# Altium project Micro 26-27.PrjPcb
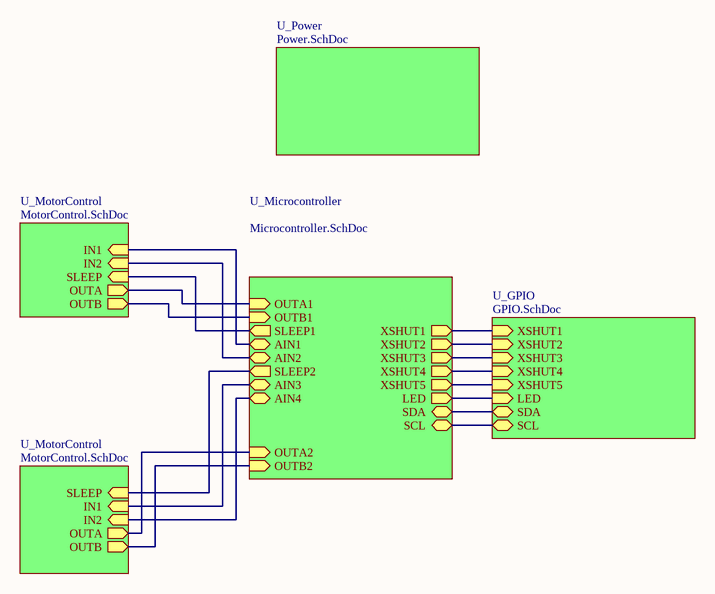
[diagram p0: Micromouse.SchDoc]
5 sheets, 51 parts. Net scope: hierarchical (ports join the sheet entries above them; power ports are global).
Board files: PCB1.PcbDoc, PCB2.PcbDoc
Sheets:
  Micromouse.SchDoc
    U_GPIO = GPIO.SchDoc
    U_Microcontroller = Microcontroller.SchDoc
    U_MotorControl = MotorControl.SchDoc
    U_Power = Power.SchDoc
    U_MotorControl = MotorControl.SchDoc

## Sheet Micromouse.SchDoc
size A

### Sub-sheets
U_GPIO = GPIO.SchDoc: XSHUT1 (in), XSHUT2 (in), XSHUT3 (in), XSHUT4 (in), XSHUT5 (in), LED (in), SCL (bidir), SDA (bidir)
U_Microcontroller = Microcontroller.SchDoc: XSHUT2 (out), AIN3 (bidir), AIN4 (bidir), SDA (bidir), SCL (bidir), AIN2 (bidir), AIN1 (bidir), XSHUT1 (out), XSHUT3 (out), XSHUT4 (out), XSHUT5 (out), LED (out), OUTA1 (in), OUTB1 (in), OUTB2 (in), OUTA2 (in), SLEEP1 (out), SLEEP2 (out)
U_MotorControl = MotorControl.SchDoc: IN2 (in), SLEEP (in), IN1 (in), OUTA (out), OUTB (out)
U_MotorControl = MotorControl.SchDoc: IN2 (in), IN1 (in), SLEEP (in), OUTA (out), OUTB (out)
U_Power = Power.SchDoc: no entries

### Nets
SCL: sheet U_GPIO/SCL, sheet U_Microcontroller/SCL
SDA: sheet U_GPIO/SDA, sheet U_Microcontroller/SDA
Net*1_0: sheet U_GPIO/XSHUT1, sheet U_Microcontroller/XSHUT1
Net*1_4: sheet U_GPIO/XSHUT2, sheet U_Microcontroller/XSHUT2
Net*1_5: sheet U_Microcontroller/AIN4, sheet U_MotorControl/IN2
Net*1_6: sheet U_Microcontroller/AIN3, sheet U_MotorControl/IN1
Net*1_7: sheet U_Microcontroller/OUTB1, sheet U_MotorControl/OUTB
Net*1_8: sheet U_Microcontroller/OUTA1, sheet U_MotorControl/OUTA
Net*1_9: sheet U_Microcontroller/SLEEP1, sheet U_MotorControl/SLEEP
Net*1_10: sheet U_Microcontroller/AIN1, sheet U_MotorControl/IN1
Net*1_11: sheet U_Microcontroller/AIN2, sheet U_MotorControl/IN2
Net*1_12: sheet U_GPIO/LED, sheet U_Microcontroller/LED
Net*1_13: sheet U_Microcontroller/OUTA2, sheet U_MotorControl/OUTA
Net*1_14: sheet U_Microcontroller/OUTB2, sheet U_MotorControl/OUTB
Net*1_15: sheet U_Microcontroller/SLEEP2, sheet U_MotorControl/SLEEP
Net*1_21: sheet U_GPIO/XSHUT4, sheet U_Microcontroller/XSHUT4
Net*1_22: sheet U_GPIO/XSHUT5, sheet U_Microcontroller/XSHUT5
Net*1_23: sheet U_GPIO/XSHUT3, sheet U_Microcontroller/XSHUT3

## Sheet GPIO.SchDoc
size A
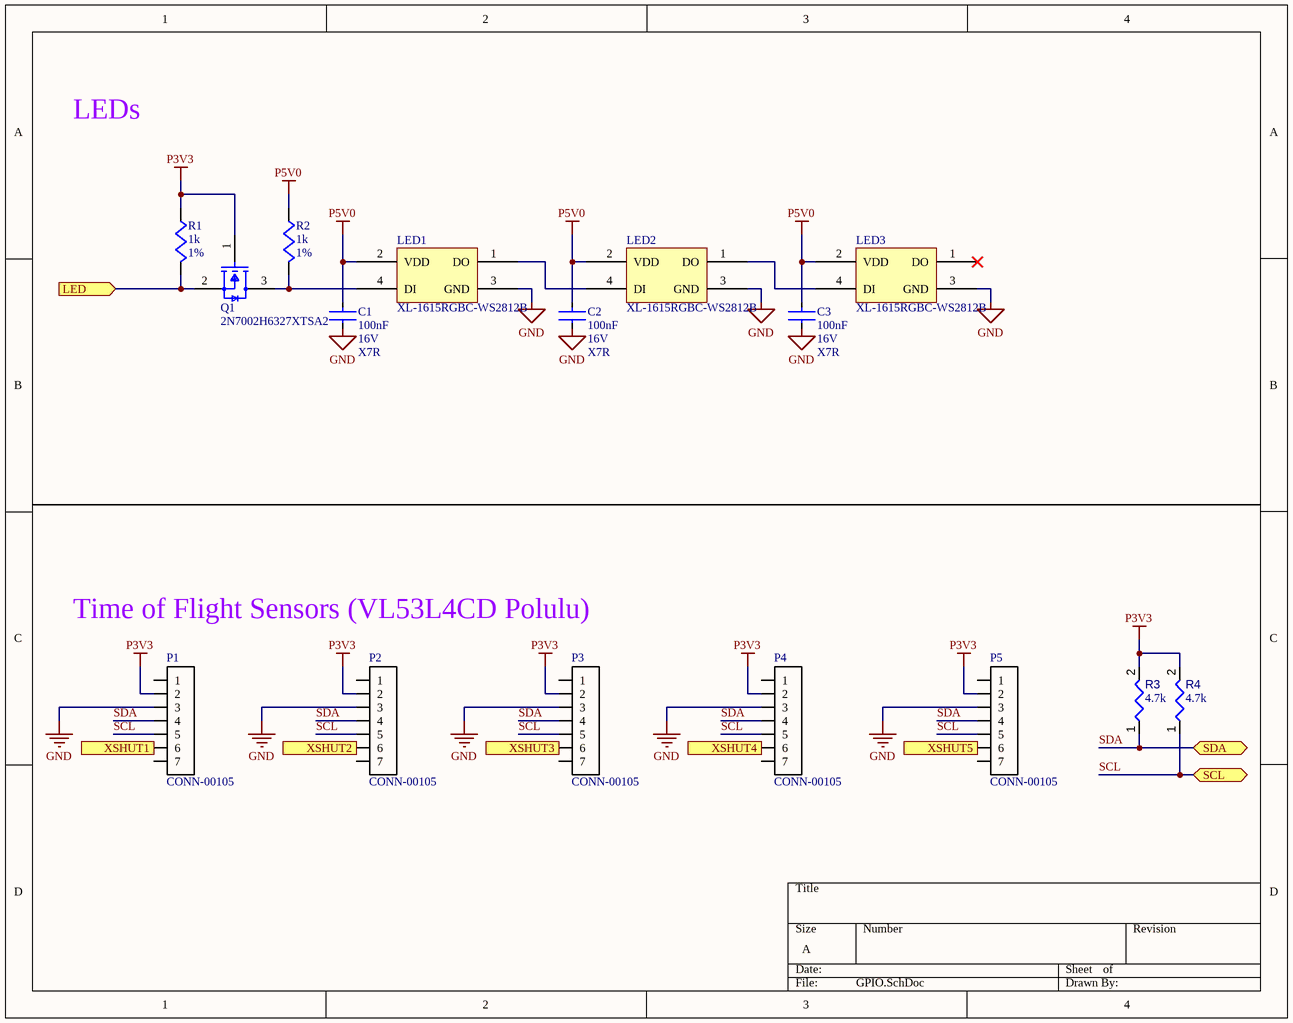
[diagram p1: GPIO.SchDoc]

### Parts
C1  value 100nF  Voltage: 16V  Dielectric: X7R  [C0402]  (hidden comment: 100n 16V X7R 0402)
C2  value 100nF  Voltage: 16V  Dielectric: X7R  [C0402]  (hidden comment: 100n 16V X7R 0402)
C3  value 100nF  Voltage: 16V  Dielectric: X7R  [C0402]  (hidden comment: 100n 16V X7R 0402)
LED1  XL-1615RGBC-WS2812B  [XL-1615RGBC-WS2812B-Footprint-1]
LED2  XL-1615RGBC-WS2812B  [XL-1615RGBC-WS2812B-Footprint-1]
LED3  XL-1615RGBC-WS2812B  [XL-1615RGBC-WS2812B-Footprint-1]
P1  CONN-00105  [HDDR_7x1_0]
P2  CONN-00105  [HDDR_7x1_0]
P3  CONN-00105  [HDDR_7x1_0]
P4  CONN-00105  [HDDR_7x1_0]
P5  CONN-00105  [HDDR_7x1_0]
Q1  2N7002H6327XTSA2  [FP-PG-SOT23-3-MFG]
R1  value 1k  Tolerance: 1%  [R0402]  (hidden comment: 1k 1% 0402)
R2  value 1k  Tolerance: 1%  [R0402]  (hidden comment: 1k 1% 0402)
R3  value 4.7k  [RESC2013X70X40ML20T20]  (hidden comment: Resistor 4k7 +/-1% 0805 125 mW)
R4  value 4.7k  [RESC2013X70X40ML20T20]  (hidden comment: Resistor 4k7 +/-1% 0805 125 mW)

### Ports
LED (in), SCL (bidir), SDA (bidir), XSHUT1 (in), XSHUT2 (in), XSHUT3 (in), XSHUT4 (in), XSHUT5 (in)

### Nets
GND: C1.2 C2.2 C3.2 LED1.3(GND) LED2.3(GND) LED3.3(GND) P1.3 P2.3 P3.3 P4.3 P5.3
P3V3: P1.2 P2.2 P3.2 P4.2 P5.2 Q1.1(gate) R1.1 R3.2 R4.2
P5V0: C1.1 C2.1 C3.1 LED1.2(VDD) LED2.2(VDD) LED3.2(VDD) R2.1
SCL: P1.5 P2.5 P3.5 P4.5 P5.5 R4.1 ; port SCL
SDA: P1.4 P2.4 P3.4 P4.4 P5.4 R3.1 ; port SDA
Net*1_0: P1.6 ; port XSHUT1
Net*1_4: P2.6 ; port XSHUT2
Net*1_12: Q1.2(source) R1.2 ; port LED
Net*1_21: P4.6 ; port XSHUT4
Net*1_22: P5.6 ; port XSHUT5
Net*1_23: P3.6 ; port XSHUT3
NetLED1_1: LED1.1(DO) LED2.4(DI)
NetLED1_4: LED1.4(DI) Q1.3(drain) R2.2
NetLED2_1: LED2.1(DO) LED3.4(DI)

Not connected (* = marked no-connect by the designer): LED3 1(DO)*; P1 1 7; P2 1 7; P3 1 7; P4 1 7; P5 1 7

### Notes on the sheet
- LEDs
- Time of Flight Sensors (VL53L4CD Polulu)

### Library data of the parts
C1-C3 = CMP-001-00088-6: 100nF 16V X7R ±10% 0402 Multilayer Ceramic Capacitors MLCC - SMD/SMT ROHS; LCSC Part #: C1525; Package: 0402
LED1-LED3 = CMP-007-00038-3: 1615  RGB LEDs(Built-in IC) ROHS; LED Type: Addressable; LCSC Part #: C5349954; Package: SMD-4P,1.6x1.5mm
P1-P5 = CMP-019-000100-1: Header, 7x1, 0.1"; Manufacturer: Samtec; Manufacturer PN: TSW-107-07-F-S; Positions per level: 7; Levels: 1; Type: Header; Cost: 0.61; Part Number: CONN-00105; Pin Count: 7; Component Type: Standard; Design Item ID: CONN-00105; Source: Connectors$.SchLib
Q1 = CMP-32901-000180-1: MOSFET N-CH 60V 0.3A SOT23; Rise Time: 3.3ns; Input Capacitance: 20pF; Rds On Max: 3R; Gate to Source Voltage (Vgs): 20V; Continuous Drain Current (ID): 300mA; Max Power Dissipation: 500mW; Packaging: Tape and Reel; Mount: Surface Mount; Case/Package: SOT-23; Drain to Source Voltage (Vdss): 60V; Min Operating Temperature: -55°C; Halogen Free: Halogen Free; Max Dual Supply Voltage: 60V; Number of Pins: 3; Lead Free: Lead Free; Max Operating Temperature: 150°C
R1 R2 = CMP-009-00189-3: 62.5mW Thick Film Resistors 50V ±100ppm/℃ ±1% 1kΩ 0402 Chip Resistor - Surface Mount ROHS; LCSC Part #: C106235; Package: 0402
R3 R4 = CMP-009-00032-4: Chip Resistor, 4.7 KOhm, +/- 1%, 0.125 W, -55 to 155 degC, 0805 (2012 Metric); Power: 125mW; Voltage Rating: 150V; RoHS Compliant: True; Tolerance: 1%; Case/Package: 0805; Pins: 2; Max Operating Temperature: 155°C; Mounting Technology: SM; Min Operating Temperature: -55°C

## Sheet Microcontroller.SchDoc
size A
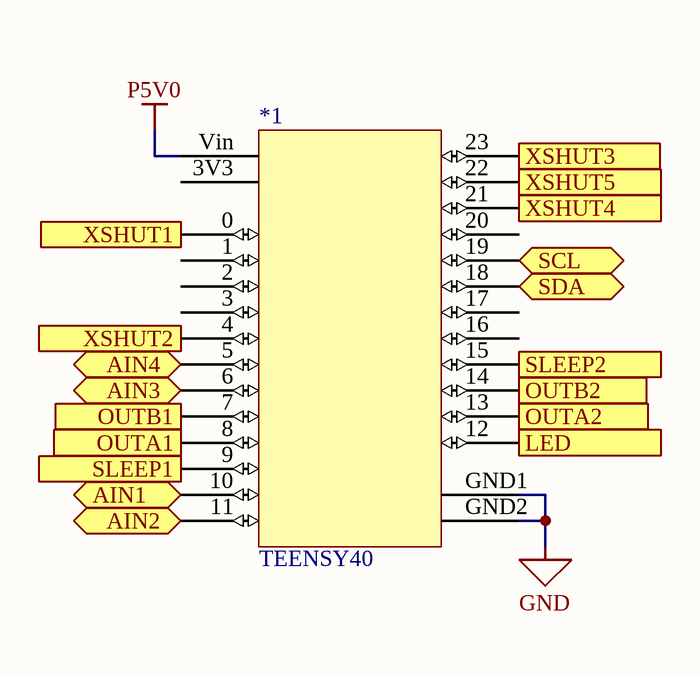
[diagram p2: Microcontroller.SchDoc]

### Parts
*1  TEENSY40  [TEENSY40-Footprint-1]

### Ports
AIN1 (bidir), AIN2 (bidir), AIN3 (bidir), AIN4 (bidir), LED (out), OUTA1 (in), OUTA2 (in), OUTB1 (in), OUTB2 (in), SCL (bidir), SDA (bidir), SLEEP1 (out), SLEEP2 (out), XSHUT1 (out), XSHUT2 (out), XSHUT3 (out), XSHUT4 (out), XSHUT5 (out)

### Nets
GND: *1.GND1(GND) *1.GND2(GND)
P5V0: *1.Vin
SCL: *1.19 ; port SCL
SDA: *1.18 ; port SDA
Net*1_0: *1.0 ; port XSHUT1
Net*1_4: *1.4 ; port XSHUT2
Net*1_5: *1.5 ; port AIN4
Net*1_6: *1.6 ; port AIN3
Net*1_7: *1.7 ; port OUTB1
Net*1_8: *1.8 ; port OUTA1
Net*1_9: *1.9 ; port SLEEP1
Net*1_10: *1.10 ; port AIN1
Net*1_11: *1.11 ; port AIN2
Net*1_12: *1.12 ; port LED
Net*1_13: *1.13 ; port OUTA2
Net*1_14: *1.14 ; port OUTB2
Net*1_15: *1.15 ; port SLEEP2
Net*1_21: *1.21 ; port XSHUT4
Net*1_22: *1.22 ; port XSHUT5
Net*1_23: *1.23 ; port XSHUT3

Not connected (* = marked no-connect by the designer): *1 1 2 3 3V3 16 17 20

### Library data of the parts
*1 = CMP-020-00024-3: PJRC Teensy 4.0 USB Development Board

## Sheet MotorControl.SchDoc
size A
Used 2 times, as channels U_MotorControl, U_MotorControl. Parts and nets are listed once, with the designators drawn on the sheet.
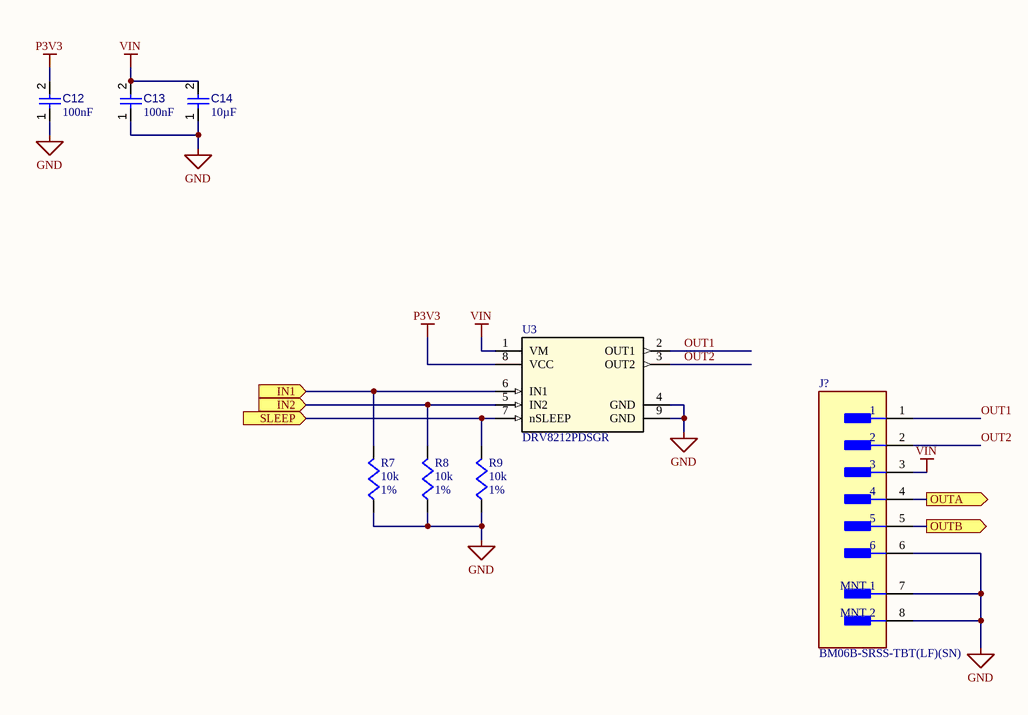
[diagram p3: MotorControl.SchDoc]

### Parts
C12  value 100nF  [CAPC0402(1005)60_L]  (hidden comment: Capacitor 100nF +/-20% 25V 0402)
C13  value 100nF  [CAPC0402(1005)60_L]  (hidden comment: Capacitor 100nF +/-20% 25V 0402)
C14  value 10µF  [CAPC2013X135X45NL10T25]  (hidden comment: Capacitor 10 uF +/- 10% 16 V 0805)
J?  BM06B-SRSS-TBT(LF)(SN)  [FP-BM06B-SRSS-TBT_LF_SN-MFG]
R7  value 10k  Tolerance: 1%  [R0402]  (hidden comment: 10k 1% 0402)
R8  value 10k  Tolerance: 1%  [R0402]  (hidden comment: 10k 1% 0402)
R9  value 10k  Tolerance: 1%  [R0402]  (hidden comment: 10k 1% 0402)
U3  DRV8212PDSGR  [WSON8_DSG_TEX]

### Ports
IN1 (in), IN2 (in), OUTA (out), OUTB (out), SLEEP (in)

### Nets
GND: C12.1 C13.1 C14.1 J?.6 J?.7(MNT_1) J?.8(MNT_2) R7.1 R8.1 R9.1 U3.4(GND) U3.9(GND)
P3V3: C12.2 U3.8(VCC)
VIN: C13.2 C14.2 J?.3 U3.1(VM)
IN1: R7.2 U3.6(IN1) ; port IN1
IN2: R8.2 U3.5(IN2) ; port IN2
OUT1: J?.1 U3.2(OUT1)
OUT2: J?.2 U3.3(OUT2)
OUTA: J?.4 ; port OUTA
OUTB: J?.5 ; port OUTB
SLEEP: R9.2 U3.7(nSLEEP) ; port SLEEP

### Channels
U_MotorControl: designators end in _2; ports IN1=Net*1_10 IN2=Net*1_11 OUTA=Net*1_8 OUTB=Net*1_7 SLEEP=Net*1_9
U_MotorControl: designators end in _1; ports IN1=Net*1_6 IN2=Net*1_5 OUTA=Net*1_13 OUTB=Net*1_14 SLEEP=Net*1_15

### Library data of the parts
C12 C13 = CMP-001-00065-3: Chip Capacitor, 100nF +/-20%, 25V, 0402, Thickness 0.6 mm; Tolerance: 10%; Max Operating Temperature: 85°C; Pins: 2; Mounting Technology: SMT; Min Operating Temperature: -55°C; Case/Package: 0402; Voltage Rating: 25V
C14 = CMP-001-00015-7: Chip Capacitor, 10 uF, +/- 10%, 16 V, 0805 (2012 Metric); Voltage Rating: 16V; Capacitor Type: Ceramic; Case/Package: 0805; Max Operating Temperature: 85°C; Tolerance: 10%; Mounting Technology: SM; Pins: 2; RoHS Compliant: True; Min Operating Temperature: -55°C
J? = CMP-17439-000255-1: CONN HEADER SMD 6POS 1MM; Voltage Rating: 50V; Number of Positions: 6; Current Rating: 1A; Gender: Male; Contact Resistance: 20mR; Insulation Resistance: 100MR; Mated Stacking Heights: 4.9mm; Number of Rows: 1; Contact Type: Male Pin; Pitch: 1mm; Length: 8mm; Max Operating Temperature: 85°C; Mount: Surface Mount; Material: Polyamide; Depth: 3.6mm; Housing Color: Natural; Orientation: Straight; Termination: Solder; Package Quantity: 1; Min Operating Temperature: -25°C; Contact Shape: Square; Insulation Color: Natural; Connector Type: Header; Max Voltage Rating (DC): 50V; Insulation Material: Nylon; Flammability Rating: UL94 V-0; Color: Natural; Contact Plating: Tin; Lead Free: Lead Free; Packaging: Tape and Reel; Contact Material: Copper Alloy; Series: SR; Housing Material: Polyamide; Contact Finish - Mating: TIN; Max Voltage Rating (AC): 50V; Fastening Type: Pull; Max Current Rating: 1A
R7-R9 = CMP-009-00187-3: 62.5mW Thick Film Resistors 50V ±100ppm/℃ ±1% 10kΩ 0402 Chip Resistor - Surface Mount ROHS; Package: 0402; LCSC Part #: C60490
U3 = CMP-152-000000-2: 12-V, 3-A H-bridge motor driver, PWM control&nbsp;with low power sleep mode 8-WSON -40 to 125; Manufacturer_Name: Texas Instruments; Copyright: Copyright (C) 2026 Ultra Librarian. All rights reserved.; Type: Type; Manufacturer_Part_Number: DRV8212PDSGR; RefDes: RefDes; Source: DRV8212PDSGR.SchLib; Design Item ID: DRV8212PDSGR

## Sheet Power.SchDoc
size A
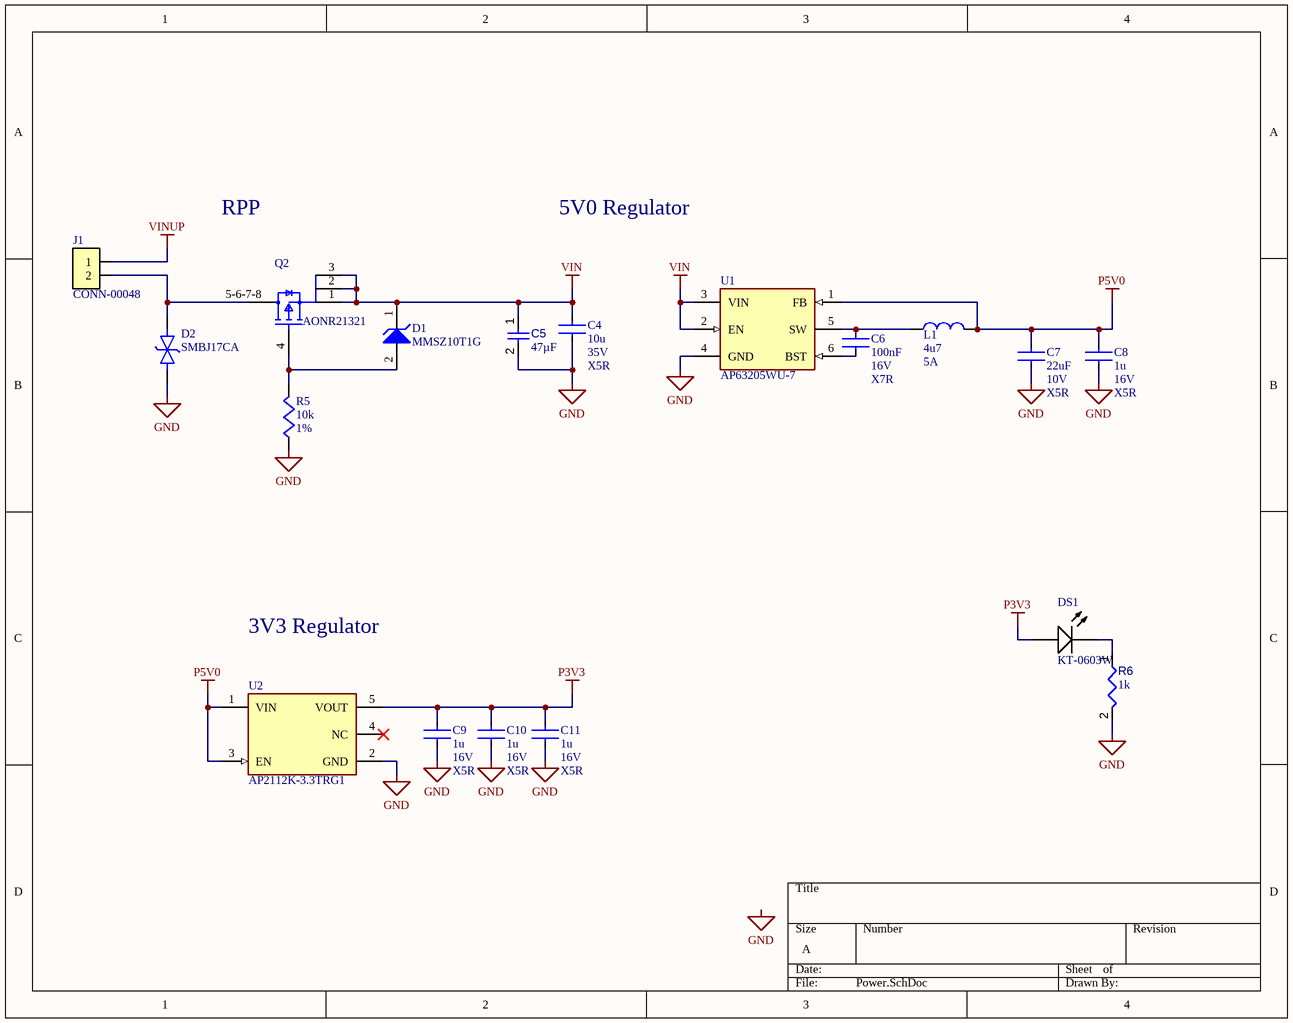
[diagram p4: Power.SchDoc]

### Parts
C4  value 10u  Voltage: 35V  Dielectric: X5R  [C0603]  (hidden comment: 10uF 35V 0603)
C5  value 47µF  [CAPC0805(2012)145_L]  (hidden comment: Capacitor 47µF +/-40% 6.3V 0805)
C6  value 100nF  Voltage: 16V  Dielectric: X7R  [C0402]  (hidden comment: 100n 16V X7R 0402)
C7  value 22uF  Voltage: 10V  Dielectric: X5R  [C0603]  (hidden comment: 22uF 10V 0603 X5R)
C8  value 1u  Voltage: 16V  Dielectric: X5R  [C0402]  (hidden comment: 1uF 16V X5R 0402)
C9  value 1u  Voltage: 16V  Dielectric: X5R  [C0402]  (hidden comment: 1uF 16V X5R 0402)
C10  value 1u  Voltage: 16V  Dielectric: X5R  [C0402]  (hidden comment: 1uF 16V X5R 0402)
C11  value 1u  Voltage: 16V  Dielectric: X5R  [C0402]  (hidden comment: 1uF 16V X5R 0402)
D1  MMSZ10T1G  [ONSC-SOD-123-2-425-04_V]
D2  SMBJ17CA  [DO214-AA]
DS1  KT-0603W  [LED0603]
J1  CONN-00048  [JST_PHR_2_0]
L1  value 4u7  Saturation Current: 5A  [INDP5452X30N]  (hidden comment: 4.7uH 4.5A FXL0530-4R7-M)
Q2  AONR21321  [FP-DFN3x3A_8L_EP1_P-MFG]
R5  value 10k  Tolerance: 1%  [R0402]  (hidden comment: 10k 1% 0402)
R6  value 1k  [RESC0805(2012)_L]  (hidden comment: Resistor 1K +/-5% 0805 125 mW)
U1  AP63205WU-7  [FP-TSOT26-IPC_B]
U2  AP2112K-3.3TRG1  [FP-SOT25-IPC_A]

### Nets
GND: C4.2 C5.2 C7.2 C8.2 C9.2 C10.2 C11.2 D2.1 R5.1 R6.2 U1.4(GND) U2.2(GND)
P3V3: C9.1 C10.1 C11.1 DS1.2(A) U2.5(VOUT)
P5V0: C7.1 C8.1 L1.2 U1.1(FB) U2.1(VIN) U2.3(EN)
VIN: C4.1 C5.1 D1.1(K) Q2.1(S) Q2.2(S) Q2.3(S) U1.2(EN) U1.3(VIN)
VINUP: J1.1
NetC6_1: C6.1 L1.1 U1.5(SW)
NetC6_2: C6.2 U1.6(BST)
NetD1_2: D1.2(A) Q2.4(G) R5.2
NetD2_2: D2.2 J1.2 Q2.5-6-7-8(D)
NetDS1_1: DS1.1(K) R6.1

Not connected (* = marked no-connect by the designer): U2 4(NC)*

### Notes on the sheet
- RPP
- 5V0 Regulator
- 3V3 Regulator
- Labels drawn without touching a wire or pin: GND

### Library data of the parts
C4 = CMP-001-00102-3: 35V 10uF X5R ±20% 0603 Multilayer Ceramic Capacitors MLCC - SMD/SMT ROHS; Package: 0603; LCSC Part #: C194427
C5 = CMP-001-00082-3: Chip Capacitor, 47µF +/-40%, 6.3V, 0805, Thickness 1.45 mm; Tolerance: 10%; Mounting Technology: SMT; Min Operating Temperature: -55°C; Voltage Rating: 6.3V; Max Operating Temperature: 85°C; Case/Package: 0805; Pins: 2
C6 = CMP-001-00088-6: as C1 on sheet GPIO; LCSC Part #: C1525; Package: 0402
C7 = CMP-001-00110-2: 10V 22uF X5R ±20% 0603 Multilayer Ceramic Capacitors MLCC - SMD/SMT ROHS; LCSC Part #: C86295; Package: 0603
C8-C11 = CMP-001-00098-3: 16V 1uF X5R ±10% 0402 Multilayer Ceramic Capacitors MLCC - SMD/SMT ROHS; LCSC Part #: C29266; Package: 0402
D1 = CMP-1060-00410-1: Zener Voltage Regulator, 500 mW, 2-Pin SOD-123, Pb-Free, Tape and Reel; Manufacturer: On Semiconductor; P Max (W): 0.5; ComponentLink1URL: http://www.onsemi.com/; RoHS: Pb-Free; ComponentLink3Description: Package Specification; Packing: Tape and Reel; PackageVersion: Rev. G, 10/2009; ComponentLink3URL: http://www.onsemi.com/pub_link/Collateral/425-04.PDF; PartNumber: MMSZ10T1G; ComponentLink2Description: Datasheet; Mounting Technology: Surface Mount; PackageReference: SOD-123-2-425-04; DatasheetVersion: Rev. 11; ComponentLink1Description: Manufacturer URL; ComponentLink2URL: http://www.onsemi.com/pub_link/Collateral/MMSZ2V4T1-D.PDF; PackageDescription: 2-Pin SOD, Body 1.6 x 2.69 mm
D2 = CMP-004-00048-1: Trans Voltage Suppressor Diode, 600W, 17V V(RWM), Bidirectional, 1 Element, Silicon; Max Operating Temperature: 170°C; Min Operating Temperature: -55°C
DS1 = CMP-00026-00001-1: Forward Voltage Min: 2.6; Forward Voltage Max: 3.1; Case/Package: 0603; Pins: 2
J1 = CMP-019-000047-1: JST PH 2x1, THT, 2.00mm Pitch; Manufacturer PN: B2B-PH-K; Positions per level: 2; Levels: 1; Pin Count: 2; Component Type: Standard; Type: Header; Part Number: CONN-00048; Source: Connectors$.SchLib; Design Item ID: CONN-00048; Cost: 0.19; Manufacturer: JST
L1 = CMP-006-00030-1: 4.5A 4.7uH Integrated molded inductor ±20% 5A SMD,5.2x5.4mm Power Inductors ROHS; LCSC Part #: C177246; Footprint: SMD,5.2x5.4mm
Q2 = CMP-83955-000004-1: MOSFET P-CH 30V 3X3 DFN EP; Manufacturer: Alpha & Omega Semiconductor; Power Dissipation: 4.1W; Threshold Vgs Max: -2.3V; Reverse Recovery Time: 10ns; Max Forward Diode Voltage: -1V; Typ Forward Diode Voltage: -0.72V; Threshold Vgs Min: -1.3V; Standoff Height: 0mm; Number Of P Channels: 1; Max Junction Temp: +150°C; Reverse Recovery Charge: 15nC; Transconductance: 25S; Depletion Mode: False; Gate To Source Voltage: 25V; Continuous Drain Current: -24A; Turn On Delay Time: 10.5ns; Rthja Max: 60°C/W; Drain To Source Voltage: -30V; Pulse Drain Current: -66A; Turn Off Delay Time: 30ns; Gate Charge At Vgs: 21nC @ -10V; Drain To Source Resistance: 13.5mΩ; Input Capacitace At Vds: 1180pF @ -15V; Manufacturer Part Number: AONR21321; Temperature: -55°C to +150°C; Package: DFN3x3A_8L_EP1_P; Digikey Description: MOSFET P-CH 30V 3X3 DFN EP; RoHS: TRUE; Lead Free: Yes; Footprint Url: http://www.aosmd.com/res/packaging_information/DFN3x3-8L.pdf; Category: Trans; Temperature Range Low: -55°C; ComponentLink2URL: http://www.aosmd.com/pdfs/datasheet/AONR21321.pdf; Temperature Range High: +150°C; Automotive: No; Device Class L2: Transistors; Height: 0.9mm; Drain To Source Breakdown Voltage: -30V; Device Class L3: MOSFETs; Number Of Channels: 1; Octopart: https://octopart.com/aonr21321-alpha+%26+omega+semiconductor-96014005; Device Class L1: Discrete Semiconductors; ComponentLink2Description: Datasheet
R5 = CMP-009-00187-3: as R7 on sheet MotorControl; Package: 0402; LCSC Part #: C60490
R6 = CMP-009-00118-2: Chip Resistor, 1 kOhms, +/-5%, 125 mW, -55 to 155 degC, 0805; Power: 125mW; Tolerance: 5%; Max Operating Temperature: 155°C; Min Operating Temperature: -55°C; Pins: 2; Case/Package: 0805
U1 = CMP-019-00066-4: Switching Regulator
U2 = CMP-12756-000035-1: IC REG LINEAR 3.3V 600MA SOT25; Number of Regulators: 1; Output Type: Fixed; Polarity: Positive; Min Input Voltage: 2.5V; Max Input Voltage: 6V; Accuracy: 1.5%; Quiescent Current: 55uA; Dropout Voltage: 250mV; Min Operating Temperature: -40°C; Length: 3.1mm; Output Current: 600mA; Max Operating Temperature: 85°C; Package Quantity: 1; Output Voltage: 3.3V; Width: 1.7mm; Number of Outputs: 1; Packaging: Tape and Reel; Height: 1.3mm; Lead Free: Lead Free; Max Output Current: 600mA; Case/Package: SOT-23-5; Mount: Surface Mount; Number of Pins: 5

## Nets that join several sheets
GND: GPIO (11 pins), Microcontroller (*1.GND1 *1.GND2), U_MotorControl (11 pins), Power (12 pins), U_MotorControl (11 pins)
P3V3: GPIO (9 pins), U_MotorControl (C12_2.2 U3_2.8), Power (5 pins), U_MotorControl (C12_1.2 U3_1.8)
P5V0: GPIO (7 pins), Microcontroller (*1.Vin), Power (6 pins)
VIN: U_MotorControl (C13_2.2 C14_2.2 J?_2.3 U3_2.1), Power (8 pins), U_MotorControl (C13_1.2 C14_1.2 J?_1.3 U3_1.1)
Net*1_0: GPIO (P1.6), Microcontroller (*1.0)
Net*1_4: GPIO (P2.6), Microcontroller (*1.4)
Net*1_5: Microcontroller (*1.5), U_MotorControl (R8_1.2 U3_1.5)
Net*1_6: Microcontroller (*1.6), U_MotorControl (R7_1.2 U3_1.6)
Net*1_7: Microcontroller (*1.7), U_MotorControl (J?_2.5)
Net*1_8: Microcontroller (*1.8), U_MotorControl (J?_2.4)
Net*1_9: Microcontroller (*1.9), U_MotorControl (R9_2.2 U3_2.7)
Net*1_10: Microcontroller (*1.10), U_MotorControl (R7_2.2 U3_2.6)
Net*1_11: Microcontroller (*1.11), U_MotorControl (R8_2.2 U3_2.5)
Net*1_12: GPIO (Q1.2 R1.2), Microcontroller (*1.12)
Net*1_13: Microcontroller (*1.13), U_MotorControl (J?_1.4)
Net*1_14: Microcontroller (*1.14), U_MotorControl (J?_1.5)
Net*1_15: Microcontroller (*1.15), U_MotorControl (R9_1.2 U3_1.7)
Net*1_21: GPIO (P4.6), Microcontroller (*1.21)
Net*1_22: GPIO (P5.6), Microcontroller (*1.22)
Net*1_23: GPIO (P3.6), Microcontroller (*1.23)
SCL: GPIO (6 pins), Microcontroller (*1.19)
SDA: GPIO (6 pins), Microcontroller (*1.18)